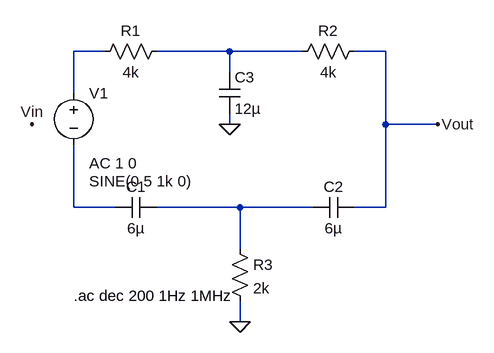
[diagram p0: schematic Draft2.1.asc]
Draft2.1.asc, the LTspice schematic file:
Version 4.1
SHEET 1 880 680
WIRE 80 96 32 96
WIRE 272 96 160 96
WIRE 384 96 272 96
WIRE 512 96 464 96
WIRE 272 128 272 96
WIRE 32 160 32 96
WIRE 272 208 272 192
WIRE 512 208 512 96
WIRE 592 208 512 208
WIRE 32 336 32 240
WIRE 96 336 32 336
WIRE 288 336 160 336
WIRE 400 336 288 336
WIRE 512 336 512 208
WIRE 512 336 464 336
WIRE 288 400 288 336
WIRE 288 512 288 480
FLAG 272 208 0
FLAG 288 512 0
FLAG 592 208 Vout
FLAG -32 208 Vin
SYMBOL res 176 80 R90
WINDOW 0 0 56 VBottom 2
WINDOW 3 32 56 VTop 2
SYMATTR InstName R1
SYMATTR Value 4k
SYMBOL res 480 80 R90
WINDOW 0 0 56 VBottom 2
WINDOW 3 32 56 VTop 2
SYMATTR InstName R2
SYMATTR Value 4k
SYMBOL cap 160 320 R90
WINDOW 0 0 32 VBottom 2
WINDOW 3 32 32 VTop 2
SYMATTR InstName C1
SYMATTR Value 6µ
SYMBOL cap 464 320 R90
WINDOW 0 0 32 VBottom 2
WINDOW 3 32 32 VTop 2
SYMATTR InstName C2
SYMATTR Value 6µ
SYMBOL res 272 384 R0
SYMATTR InstName R3
SYMATTR Value 2k
SYMBOL cap 256 128 R0
SYMATTR InstName C3
SYMATTR Value 12µ
SYMBOL voltage 32 144 R0
WINDOW 3 24 152 Left 2
WINDOW 123 24 124 Left 2
WINDOW 39 0 0 Left 0
SYMATTR InstName V1
SYMATTR Value SINE(0 5 1k 0)
SYMATTR Value2 AC 1 0
TEXT 32 472 Left 2 !.ac dec 200 1Hz 1MHz

The netlist it stands for:
* Draft2.1.asc
R1 N002 N001 4k
R2 Vout N002 4k
C1 N004 N003 6µ
C2 Vout N004 6µ
R3 N004 0 2k
C3 N002 0 12µ
V1 N001 N003 SINE(0 5 1k 0) AC 1 0
.ac dec 200 1Hz 1MHz
.backanno
.end